# Altium schematic sheet Top.SchDoc
size A; SheetNumber: 1; SheetTotal: 4
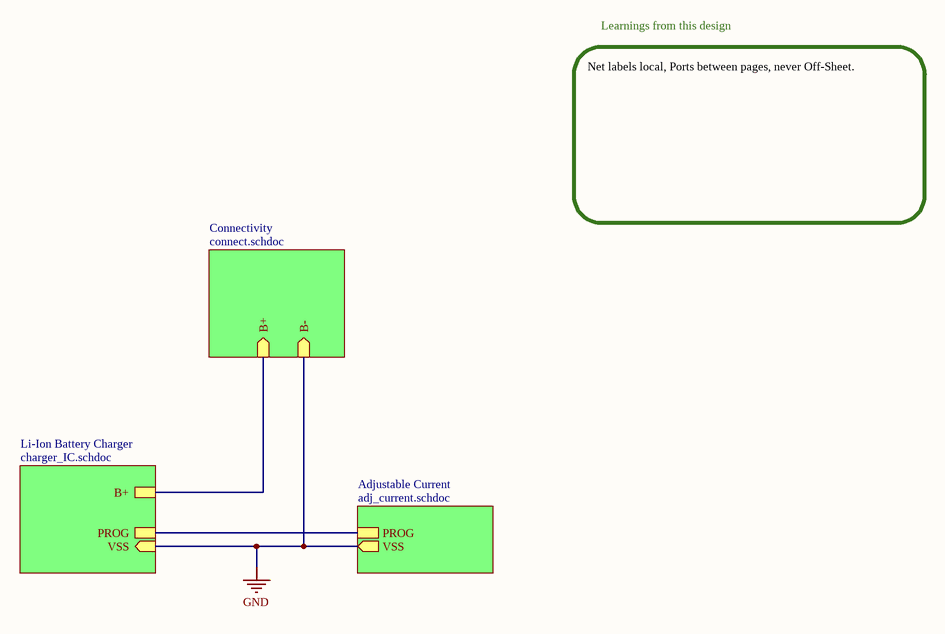
[diagram p0: Top.SchDoc]

## Sub-sheets
Adjustable Current = adj_current.schdoc: PROG, VSS (out)
Connectivity = connect.schdoc: B+ (in), B- (in)
Li-Ion Battery Charger = charger_IC.schdoc: B+, PROG, VSS (in)

## Nets
GND: sheet Li-Ion Battery Charger/VSS, sheet Connectivity/B-, sheet Adjustable Current/VSS
(unnamed): sheet Li-Ion Battery Charger/B+, sheet Connectivity/B+
(unnamed): sheet Li-Ion Battery Charger/PROG, sheet Adjustable Current/PROG

## Notes on the sheet
- Net labels local, Ports between pages, never Off‑Sheet.
- Learnings from this design